# Altium schematic sheet U_OBC_Core.SchDoc
size A3; SheetNumber: 2; SheetTotal: 9
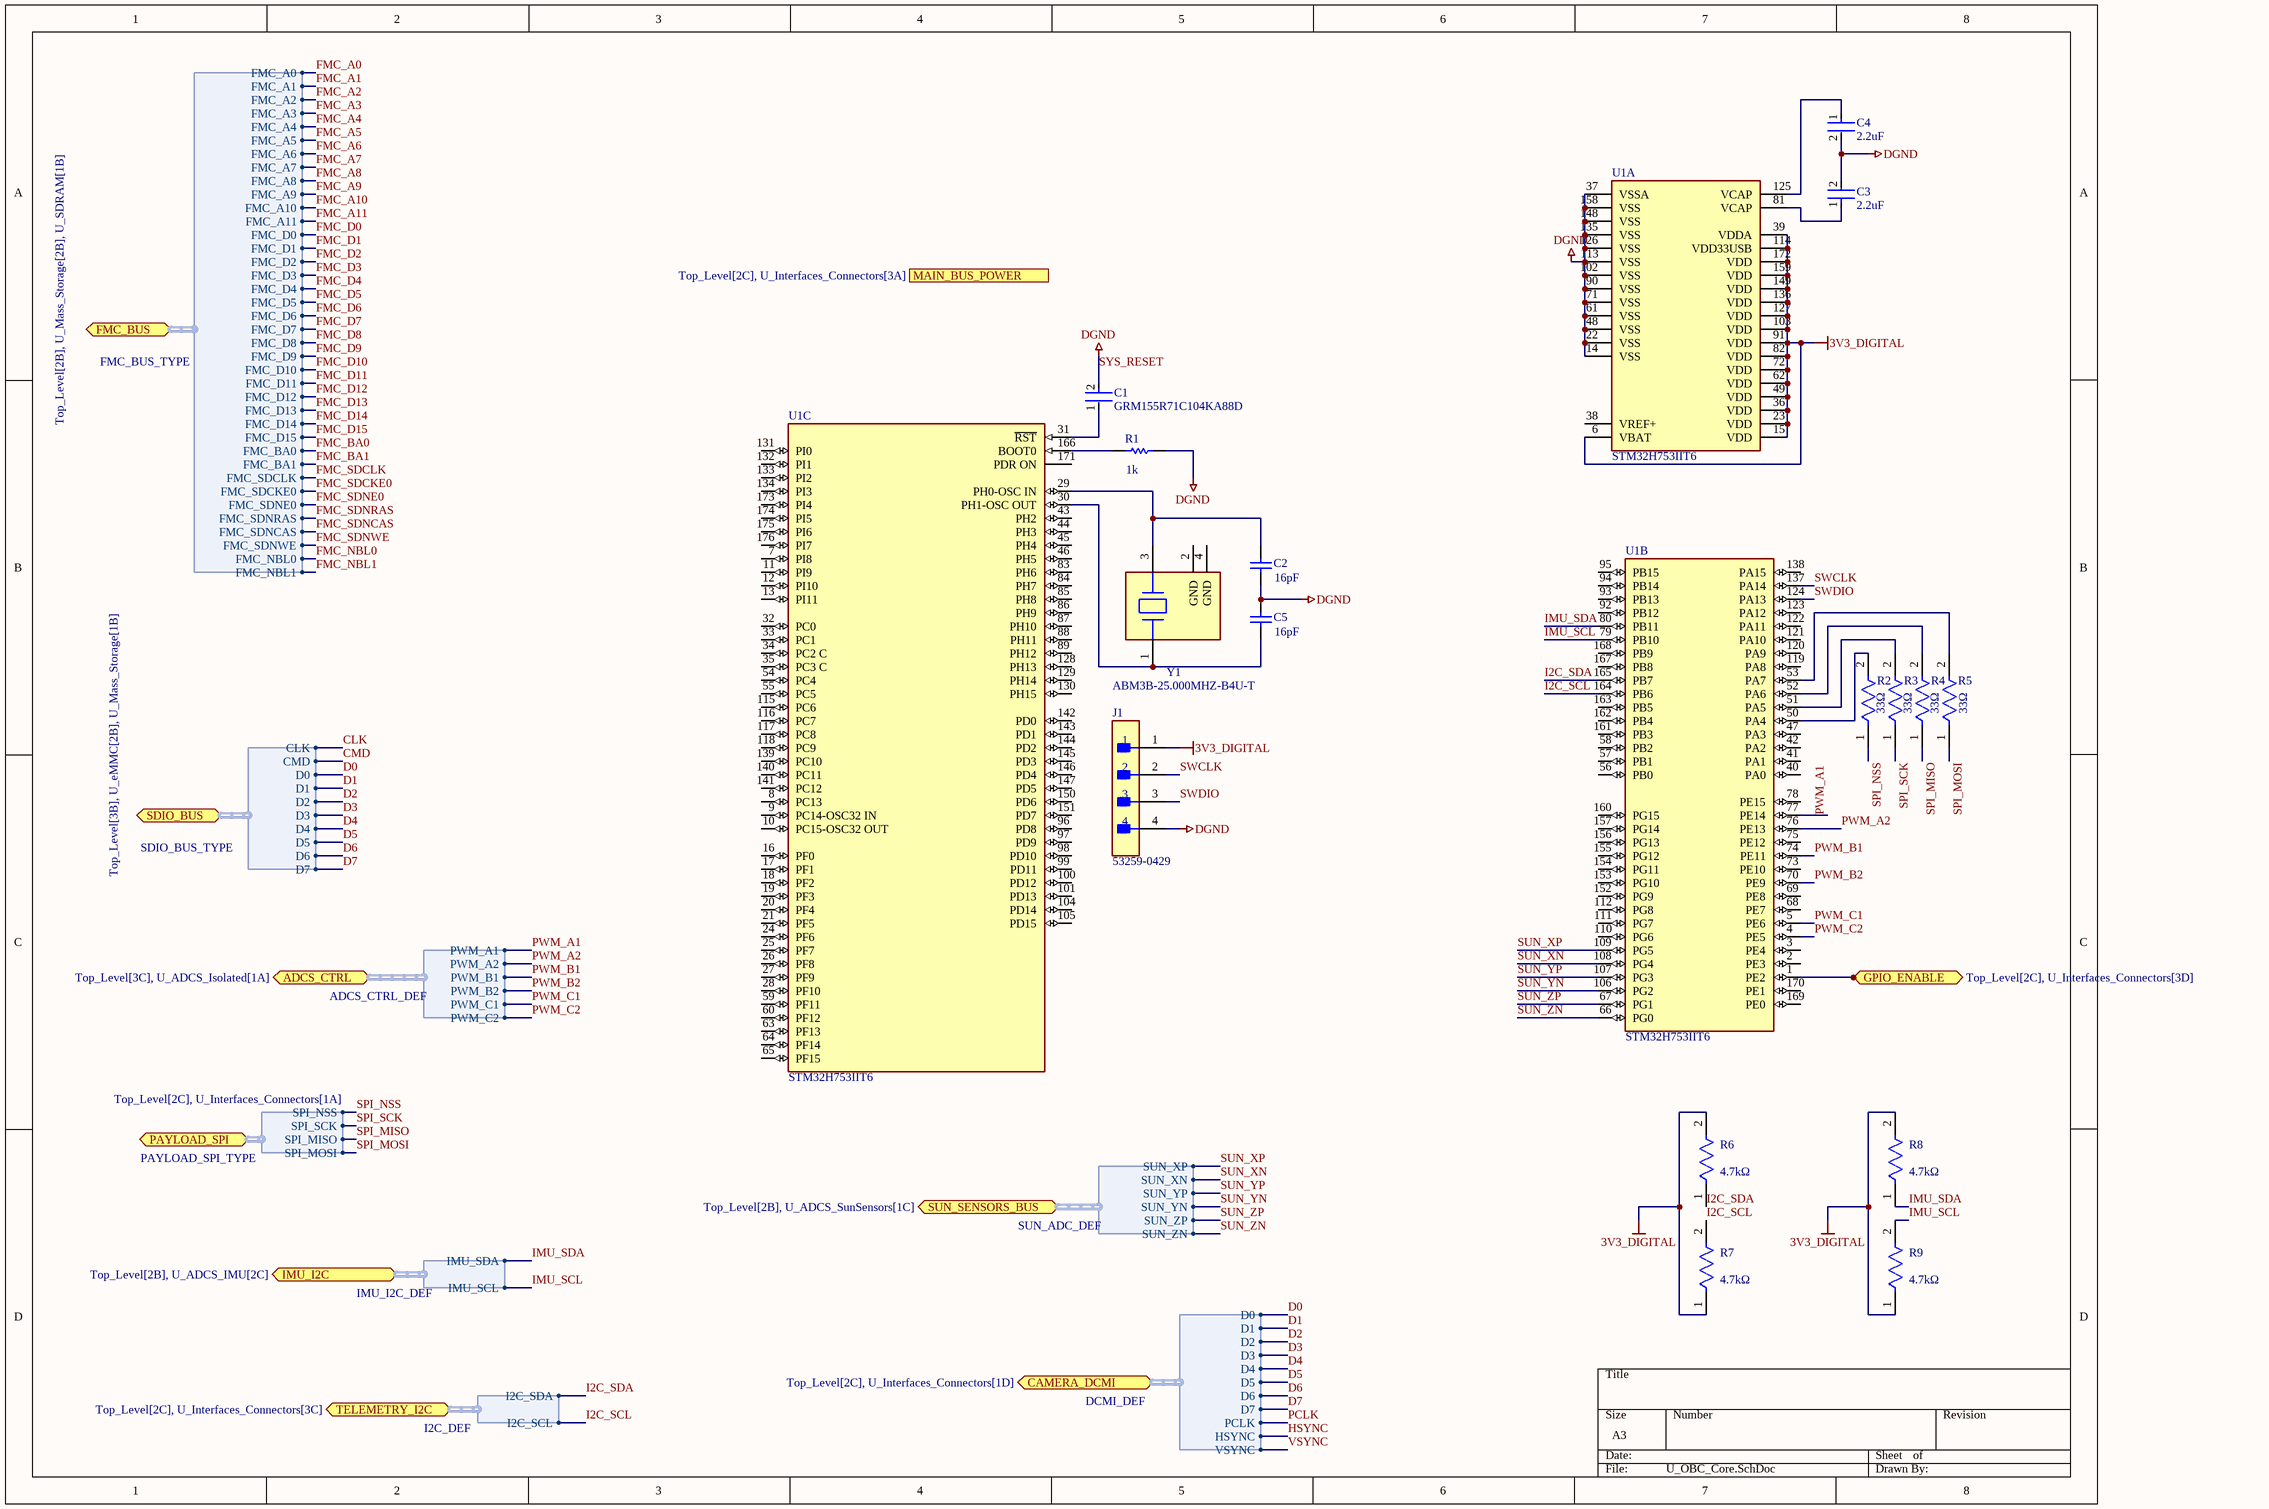
[diagram p0: U_OBC_Core.SchDoc]

## Parts
C1  GRM155R71C104KA88D  [FP-GRM15-MFG]
C2  16pF  [CAPC1005X55X25NL05T10]
C3  2.2uF  [FP-GRM188-0_1-e0_2_0_5-MFG]
C4  2.2uF  [FP-GRM188-0_1-e0_2_0_5-MFG]
C5  16pF  [CAPC1005X55X25NL05T10]
J1  53259-0429  [FP-53259-0429-MFG]
R1  1k  [RESC1609X55X30LL15T15]
R2  33Ω  [FP-CRCW0603-e3-IPC_A]
R3  33Ω  [FP-CRCW0603-e3-IPC_A]
R4  33Ω  [FP-CRCW0603-e3-IPC_A]
R5  33Ω  [FP-CRCW0603-e3-IPC_A]
R6  4.7kΩ  [FP-CRCW0603-e3-IPC_A]
R7  4.7kΩ  [FP-CRCW0603-e3-IPC_A]
R8  4.7kΩ  [FP-CRCW0603-e3-IPC_A]
R9  4.7kΩ  [FP-CRCW0603-e3-IPC_A]
U1  STM32H753IIT6  [FP-LQFP176-1T-IPC_B]  (parts A,B,C of 3)
Y1  ABM3B-25.000MHZ-B4U-T  [FP-ABM3B-MFG]

## Ports
ADCS_CTRL (bidir, harness ADCS_CTRL_DEF, see Top_Level[3C], U_ADCS_Isolated[1A]), CAMERA_DCMI (bidir, harness DCMI_DEF, see Top_Level[2C], U_Interfaces_Connectors[1D]), FMC_BUS (bidir, harness FMC_BUS_TYPE, see Top_Level[2B], U_Mass_Storage[2B], U_SDRAM[1B]), GPIO_ENABLE (bidir, see Top_Level[2C], U_Interfaces_Connectors[3D]), IMU_I2C (bidir, harness IMU_I2C_DEF, see Top_Level[2B], U_ADCS_IMU[2C]), MAIN_BUS_POWER (in, see Top_Level[2C], U_Interfaces_Connectors[3A]), PAYLOAD_SPI (bidir, harness PAYLOAD_SPI_TYPE, see Top_Level[2C], U_Interfaces_Connectors[1A]), SDIO_BUS (bidir, harness SDIO_BUS_TYPE, see Top_Level[3B], U_eMMC[2B], U_Mass_Storage[1B]), SUN_SENSORS_BUS (bidir, harness SUN_ADC_DEF, see Top_Level[2B], U_ADCS_SunSensors[1C]), TELEMETRY_I2C (bidir, harness I2C_DEF, see Top_Level[2C], U_Interfaces_Connectors[3C])

## Harnesses
PAYLOAD_SPI_TYPE: SPI_NSS, SPI_SCK, SPI_MISO, SPI_MOSI
SDIO_BUS_TYPE: CLK, CMD, D0, D1, D2, D3, D4, D5, D6, D7
FMC_BUS_TYPE: FMC_D2, FMC_D3, FMC_D4, FMC_D5, FMC_D6, FMC_D7, FMC_D8, FMC_D9, FMC_D10, FMC_D11, FMC_D12, FMC_D13, FMC_D14, FMC_D1, FMC_D15, FMC_D0, FMC_A0, FMC_A1, FMC_A2, FMC_A3, FMC_A4, FMC_A5, FMC_A6, FMC_A7, FMC_A8, FMC_A9, FMC_A10, FMC_A11, FMC_BA0, FMC_BA1, FMC_SDCLK, FMC_SDCKE0, FMC_SDNE0, FMC_SDNRAS, FMC_SDNCAS, FMC_SDNWE, FMC_NBL0, FMC_NBL1
I2C_DEF: I2C_SDA, I2C_SCL
DCMI_DEF: D0, D1, D2, D3, D4, D5, D6, D7, PCLK, HSYNC, VSYNC
IMU_I2C_DEF: IMU_SDA, IMU_SCL
SUN_ADC_DEF: SUN_XP, SUN_XN, SUN_YP, SUN_YN, SUN_ZP, SUN_ZN
ADCS_CTRL_DEF: PWM_A1, PWM_A2, PWM_B1, PWM_B2, PWM_C1, PWM_C2

## Nets
3V3_DIGITAL: J1.1 R6.2 R7.1 R8.2 R9.1 U1.6(VBAT) U1.15(VDD) U1.23(VDD) U1.36(VDD) U1.39(VDDA) U1.49(VDD) U1.62(VDD) U1.72(VDD) U1.82(VDD) U1.91(VDD) U1.103(VDD) U1.114(VDD33USB) U1.127(VDD) U1.136(VDD) U1.149(VDD) U1.159(VDD) U1.172(VDD)
SYS_RESET: C1.2 C2.1 C3.2 C4.2 C5.1 J1.4 R1.2 U1.14(VSS) U1.22(VSS) U1.37(VSSA) U1.48(VSS) U1.61(VSS) U1.71(VSS) U1.90(VSS) U1.102(VSS) U1.113(VSS) U1.126(VSS) U1.135(VSS) U1.148(VSS) U1.158(VSS)  [also labelled DGND]
CLK: port SDIO_BUS.CLK
CMD: port SDIO_BUS.CMD
D0: port SDIO_BUS.D0, port CAMERA_DCMI.D0
D1: port SDIO_BUS.D1, port CAMERA_DCMI.D1
D2: port SDIO_BUS.D2, port CAMERA_DCMI.D2
D3: port SDIO_BUS.D3, port CAMERA_DCMI.D3
D4: port SDIO_BUS.D4, port CAMERA_DCMI.D4
D5: port SDIO_BUS.D5, port CAMERA_DCMI.D5
D6: port SDIO_BUS.D6, port CAMERA_DCMI.D6
D7: port SDIO_BUS.D7, port CAMERA_DCMI.D7
FMC_A0: port FMC_BUS.FMC_A0
FMC_A1: port FMC_BUS.FMC_A1
FMC_A2: port FMC_BUS.FMC_A2
FMC_A3: port FMC_BUS.FMC_A3
FMC_A4: port FMC_BUS.FMC_A4
FMC_A5: port FMC_BUS.FMC_A5
FMC_A6: port FMC_BUS.FMC_A6
FMC_A7: port FMC_BUS.FMC_A7
FMC_A8: port FMC_BUS.FMC_A8
FMC_A9: port FMC_BUS.FMC_A9
FMC_A10: port FMC_BUS.FMC_A10
FMC_A11: port FMC_BUS.FMC_A11
FMC_BA0: port FMC_BUS.FMC_BA0
FMC_BA1: port FMC_BUS.FMC_BA1
FMC_D0: port FMC_BUS.FMC_D0
FMC_D1: port FMC_BUS.FMC_D1
FMC_D2: port FMC_BUS.FMC_D2
FMC_D3: port FMC_BUS.FMC_D3
FMC_D4: port FMC_BUS.FMC_D4
FMC_D5: port FMC_BUS.FMC_D5
FMC_D6: port FMC_BUS.FMC_D6
FMC_D7: port FMC_BUS.FMC_D7
FMC_D8: port FMC_BUS.FMC_D8
FMC_D9: port FMC_BUS.FMC_D9
FMC_D10: port FMC_BUS.FMC_D10
FMC_D11: port FMC_BUS.FMC_D11
FMC_D12: port FMC_BUS.FMC_D12
FMC_D13: port FMC_BUS.FMC_D13
FMC_D14: port FMC_BUS.FMC_D14
FMC_D15: port FMC_BUS.FMC_D15
FMC_NBL0: port FMC_BUS.FMC_NBL0
FMC_NBL1: port FMC_BUS.FMC_NBL1
FMC_SDCKE0: port FMC_BUS.FMC_SDCKE0
FMC_SDCLK: port FMC_BUS.FMC_SDCLK
FMC_SDNCAS: port FMC_BUS.FMC_SDNCAS
FMC_SDNE0: port FMC_BUS.FMC_SDNE0
FMC_SDNRAS: port FMC_BUS.FMC_SDNRAS
FMC_SDNWE: port FMC_BUS.FMC_SDNWE
GPIO_ENABLE: U1.1(PE2) ; port GPIO_ENABLE
HSYNC: port CAMERA_DCMI.HSYNC
I2C_SCL: R7.2 U1.164(PB6) ; port TELEMETRY_I2C.I2C_SCL
I2C_SDA: R6.1 U1.165(PB7) ; port TELEMETRY_I2C.I2C_SDA
IMU_SCL: R9.2 U1.79(PB10) ; port IMU_I2C.IMU_SCL
IMU_SDA: R8.1 U1.80(PB11) ; port IMU_I2C.IMU_SDA
PCLK: port CAMERA_DCMI.PCLK
PWM_A1: U1.77(PE14) ; port ADCS_CTRL.PWM_A1
PWM_A2: U1.76(PE13) ; port ADCS_CTRL.PWM_A2
PWM_B1: U1.74(PE11) ; port ADCS_CTRL.PWM_B1
PWM_B2: U1.70(PE9) ; port ADCS_CTRL.PWM_B2
PWM_C1: U1.5(PE6) ; port ADCS_CTRL.PWM_C1  [also labelled PWM_C1 ]
PWM_C2: U1.4(PE5) ; port ADCS_CTRL.PWM_C2
SPI_MISO: R4.1 ; port PAYLOAD_SPI.SPI_MISO
SPI_MOSI: R5.1 ; port PAYLOAD_SPI.SPI_MOSI
SPI_NSS: R2.1 ; port PAYLOAD_SPI.SPI_NSS
SPI_SCK: R3.1 ; port PAYLOAD_SPI.SPI_SCK
SUN_XN: U1.108(PG4) ; port SUN_SENSORS_BUS.SUN_XN
SUN_XP: U1.109(PG5) ; port SUN_SENSORS_BUS.SUN_XP
SUN_YN: U1.106(PG2) ; port SUN_SENSORS_BUS.SUN_YN
SUN_YP: U1.107(PG3) ; port SUN_SENSORS_BUS.SUN_YP
SUN_ZN: U1.66(PG0) ; port SUN_SENSORS_BUS.SUN_ZN
SUN_ZP: U1.67(PG1) ; port SUN_SENSORS_BUS.SUN_ZP
SWCLK: J1.2 U1.137(PA14)
SWDIO: J1.3 U1.124(PA13)
VSYNC: port CAMERA_DCMI.VSYNC
NetC1_1: C1.1 U1.31(~{RST})
NetC2_2: C2.2 U1.29(PH0-OSC_IN) Y1.3
NetC3_1: C3.1 U1.81(VCAP)
NetC4_1: C4.1 U1.125(VCAP)
NetC5_2: C5.2 U1.30(PH1-OSC_OUT) Y1.1
NetR1_1: R1.1 U1.166(BOOT0)
NetR2_2: R2.2 U1.50(PA4)
NetR3_2: R3.2 U1.51(PA5)
NetR4_2: R4.2 U1.52(PA6)
NetR5_2: R5.2 U1.53(PA7)

Not connected (* = marked no-connect by the designer): U1 2(PE3) 3(PE4) 7(PI8) 8(PC13) 9(PC14-OSC32_IN) 10(PC15-OSC32_OUT) 11(PI9) 12(PI10) 13(PI11) 16(PF0) 17(PF1) 18(PF2) 19(PF3) 20(PF4) 21(PF5) 24(PF6) 25(PF7) 26(PF8) 27(PF9) 28(PF10) 32(PC0) 33(PC1) 34(PC2_C) 35(PC3_C) 38(VREF+) 40(PA0) 41(PA1) 42(PA2) 43(PH2) 44(PH3) 45(PH4) 46(PH5) 47(PA3) 54(PC4) 55(PC5) 56(PB0) 57(PB1) 58(PB2) 59(PF11) 60(PF12) 63(PF13) 64(PF14) 65(PF15) 68(PE7) 69(PE8) 73(PE10) 75(PE12) 78(PE15) 83(PH6) 84(PH7) 85(PH8) 86(PH9) 87(PH10) 88(PH11) 89(PH12) 92(PB12) 93(PB13) 94(PB14) 95(PB15) 96(PD8) 97(PD9) 98(PD10) 99(PD11) 100(PD12) 101(PD13) 104(PD14) 105(PD15) 110(PG6) 111(PG7) 112(PG8) 115(PC6) 116(PC7) 117(PC8) 118(PC9) 119(PA8) 120(PA9) 121(PA10) 122(PA11) 123(PA12) 128(PH13) 129(PH14) 130(PH15) 131(PI0) 132(PI1) 133(PI2) 134(PI3) 138(PA15) 139(PC10) 140(PC11) 141(PC12) 142(PD0) 143(PD1) 144(PD2) 145(PD3) 146(PD4) 147(PD5) 150(PD6) 151(PD7) 152(PG9) 153(PG10) 154(PG11) 155(PG12) 156(PG13) 157(PG14) 160(PG15) 161(PB3) 162(PB4) 163(PB5) 167(PB8) 168(PB9) 169(PE0) 170(PE1) 171(PDR_ON) 173(PI4) 174(PI5) 175(PI6) 176(PI7); Y1 2(GND) 4(GND)

## Library data of the parts
C1 = CMP-2100-03641-2: CAP CER 0.1UF 16V X7R 0402; Manufacturer: Murata; Standoff Height: 0mm; Tolerance: 10%; Voltage Rating: 16Vdc; Material: Ceramic; Capacitance: 0.10μF; Value: 0.10μF; RoHS: TRUE; Manufacturer Part Number: GRM155R71C104KA88D; Temperature Characteristic: X7R; Octopart: https://octopart.com/grm155r71c104ka88d-murata-196880; Digikey Description: CAP CER 0.1UF 16V X7R 0402; Device Class L3: Ceramic Capacitors; Height: 0.55mm; ComponentLink2Description: Datasheet; Temperature Range Low: -55°C; Ipc Land Pattern Name: CAPC10050X219; ComponentLink2URL: https://search.murata.co.jp/Ceramy/image/img/A01X/G101/ENG/GRM155R71H471KA01-01A.pdf; Device Class L1: Passive Components; Lead Free: yes; Category: Cap; Package: GRM15; Temperature: -55°C to +125°C; Device Class L2: Capacitors; Temperature Range High: +125°C; Mouser Description: 0402 0.1 uF 16V ±10 % Tolerance X7R SMT Multilayer Ceramic Capacitor
C2 C5 = CMP-2008-03924-1: Manufacturer: Murata; Part Number: GRM1555C1H160JA01D
C3 C4 = CMP-2006-02836-2: Chip Multilayer Ceramic Capacitors for General Purpose, 0603, 2.2uF, X7R, 15%, 10%, 10V; Case Code (Metric): 1608; Height: 0.8mm; Packaging: Cut Tape; Voltage: 10V; Lead Free: Lead Free; Min Operating Temperature: -55°C; Voltage Rating (DC): 10V; Max Operating Temperature: 125°C; Voltage Rating: 10V; Dielectric: X7R; Depth: 0.8mm; Case Code (Imperial): 0603; Termination: SMD/SMT; Case/Package: 0603; Number of Pins: 2; REACH SVHC: No SVHC; Mount: Surface Mount; Width: 0.031inch; Material: Ceramic; Capacitance: 2.2uF; Package Quantity: 1; Weight: 7.1E-05oz; Length: 1.6mm; Thickness: 0.035inch; Tolerance: 10%
J1 = CMP-00257-07647115-1: 53259-0429 Mighty-SPOX Header, 3.50mm Pitch, Right-Angle, 4 Circuits, Brass (CuZn) Contact; Manufacturer Lifecycle Status: ACTIVE; Number of Circuits: 4; Pitch: 3.5mm; Plating: Tin; Glow Wire Compliant: Non-compliant; Voltage Rating: 250V; Current Rating: 5.5A; Contact Material: Brass; NexarPartId: 7647115; Orientation: Right Angle; Termination: Through Hole; Number of Positions: 4; Number of Rows: 1; Country of Origin: KR; RoHS: Compliant; Contact Plating: Tin; Lifecycle Status: Production
R1 = CMP-1012-00623-3: Chip Resistor, 10 KOhm, +/- 1%, 0.1 W, -55 to 155 degC, 0603 (1608 Metric), RoHS, Tape and Reel; Manufacturer: Panasonic; Voltage Rating: 75V; Case\/Package: 0603; Power Rating: 100mW; Resistance: 10KOhm; Temperature Coefficient: 100ppm\/degreesC; Number of Pins: 2; Package Reference: 603; Depth: 0.8mm; Mount: SurfaceMount; Package Description: 2-Pin Surface Mount Device, Body 1.6 x 0.85 mm; Datasheet Version: 02/2017; Length: 1.6mm; Lead Free: LeadFree; Height: 0.45mm; Number of Terminations: 2; Max Power Dissipation: 100mW; Min Operating Temperature: -55degC; Datasheet URL: https://industrial.panasonic.com/cdbs/www-data/pdf/RDA0000/AOA0000C304.pdf; Termination: SMD/SMT; Case Code (Metric): 1608; Case Code (Imperial): 0603; Tolerance: 1%; Max Operating Temperature: 155degC; RoHSCompliant: true; Voltage Rating (DC): 75V; Radiation Hardening: No; Packaging: TapeandReel; Composition: ThickFilm; Mounting Technology: SurfaceMount; Manufacturer URL: http://www.panasonic.com/; Width: 0.031inch; REACH SVHC: NoSVHC; Contact Plating: Tin; Military Standard: Not; Package Quantity: 1
R2-R5 = CMP-2000-03250-2: RES Thick Film, 33Ω, 1%, 0.1W, 100ppm/°C, 0603; Voltage Rating: 75V; Max Power Dissipation: 100mW; Resistance: 33R; Case/Package: 0603; Weight: 7.1E-05oz; Termination: SMD/SMT; Voltage Rating (DC): 75V; Packaging: Tape and Reel; Width: 0.85mm; Depth: 0.85mm; Mount: Surface Mount; Number of Terminations: 2; Min Operating Temperature: -55°C; Military Standard: Not; Package Quantity: 10; Contact Plating: Tin; Radiation Hardening: No; Lead Free: Lead Free; Tolerance: 1%; Power Rating: 100mW; Features: Automotive AEC-Q200; Height: 0.45mm; Case Code (Metric): 1608; Length: 1.55mm; Composition: Thick Film; Max Operating Temperature: 155°C; Temperature Coefficient: 100ppm/°C; Case Code (Imperial): 0603
R6-R9 = CMP-1666-00019-3: RES Thick Film, 4.7kΩ, 1%, 0.1W, 100ppm/°C, 0603; Resistance: 4.7kR; Voltage Rating: 75V; Power Rating: 100mW; Case Code (Metric): 1608; Military Standard: Not; Packaging: Tape and Reel; Termination: SMD/SMT; Temperature Coefficient: 100ppm/°C; Lead Free: Lead Free; Length: 1.55mm; Width: 0.85mm; Height: 0.45mm; Depth: 0.85mm; Weight: 7.1E-05oz; Case Code (Imperial): 0603; Contact Plating: Tin; Case/Package: 0603; Max Operating Temperature: 155°C; Mount: Surface Mount; Tolerance: 1%; Min Operating Temperature: -55°C; Package Quantity: 5000; Voltage Rating (DC): 75V; Composition: Thick Film
U1 = STM32H753IIT6: LQFP 176 24X24X1.4; Manufacturer: STMicroelectronics; Number Of I/Os: 140; Standoff Height: 0.05mm; Memory Size: 2MBytes; Interface: I2C,SPI,UART,USART,CAN,USB,LIN,IrDA,Ethernet,I2S,SMBus,Other; Nominal Supply Current: 10-165mA; Number Of I2C Channels: 4; Number Of Timers/Counters: 20; Max Supply Voltage: 3.6V; Number Of Pwm Channels: 8; Max Junction Temp: +125°C; Number Of Uart Channels: 9; Memory Type: FLASH; Number Of Spi Channels: 6; Number Of Cores: 1; Ram Size: 1MBytes; Core Architecture: Arm Cortex-M7; Number Of Usb Channels: 2; Data Bus Width: 32bits; Frequency: 400MHz; Number Of Adc Channels: 36; Number Of A/D Converters: 3; Min Supply Voltage: 1.62V; Automotive: No; Ambient Temperature Range High: +85°C; Octopart: https://octopart.com/stm32h753iit6-stmicroelectronics-87680940; Digikey Description: LQFP 176 24X24X1.4; ComponentLink2URL: https://www.st.com/resource/en/datasheet/stm32h753ii.pdf; Manufacturer Part Number: STM32H753IIT6; RoHS: TRUE; Package: LQFP176-1T; Ambient Temperature Range Low: -40°C; Device Class L1: Integrated Circuits (ICs); Temperature: -40°C to +85°C; Ipc Land Pattern Name: QFP50P2600X2600X160-176; Category: IC; Lead Free: Yes; Device Class L2: Embedded Processors and Controllers; Temperature Range High: +85°C; ComponentLink2Description: Datasheet; Device Class L3: DSPs - Digital Signal Processors; Temperature Range Low: -40°C; Height: 1.6mm; Number Of Ethernet Channels: 1
Y1 = CMP-27762-011355-1: Crystal 25MHz ±30ppm 18pF SMD-4 5mm x 3.2mm; Frequency Stability: 10ppm; Capacitance: 1.8E-11F; ESR (Equivalent Series Resistance): 50R; Width: 0.126inch; Lead Free: Lead Free; Case/Package: SMD/SMT; Packaging: Tape and Reel; Length: 0.197inch; Load Capacitance: 18pF; Height: 0.043inch; Min Operating Temperature: -20°C; Frequency Tolerance: 30ppm; Max Operating Temperature: 70°C; Frequency: 25MHz; Mount: Surface Mount